# Altium schematic sheet Connector-Sheet.SchDoc
size 420 x 297 mm; SheetNumber: 10; SheetTotal: 11
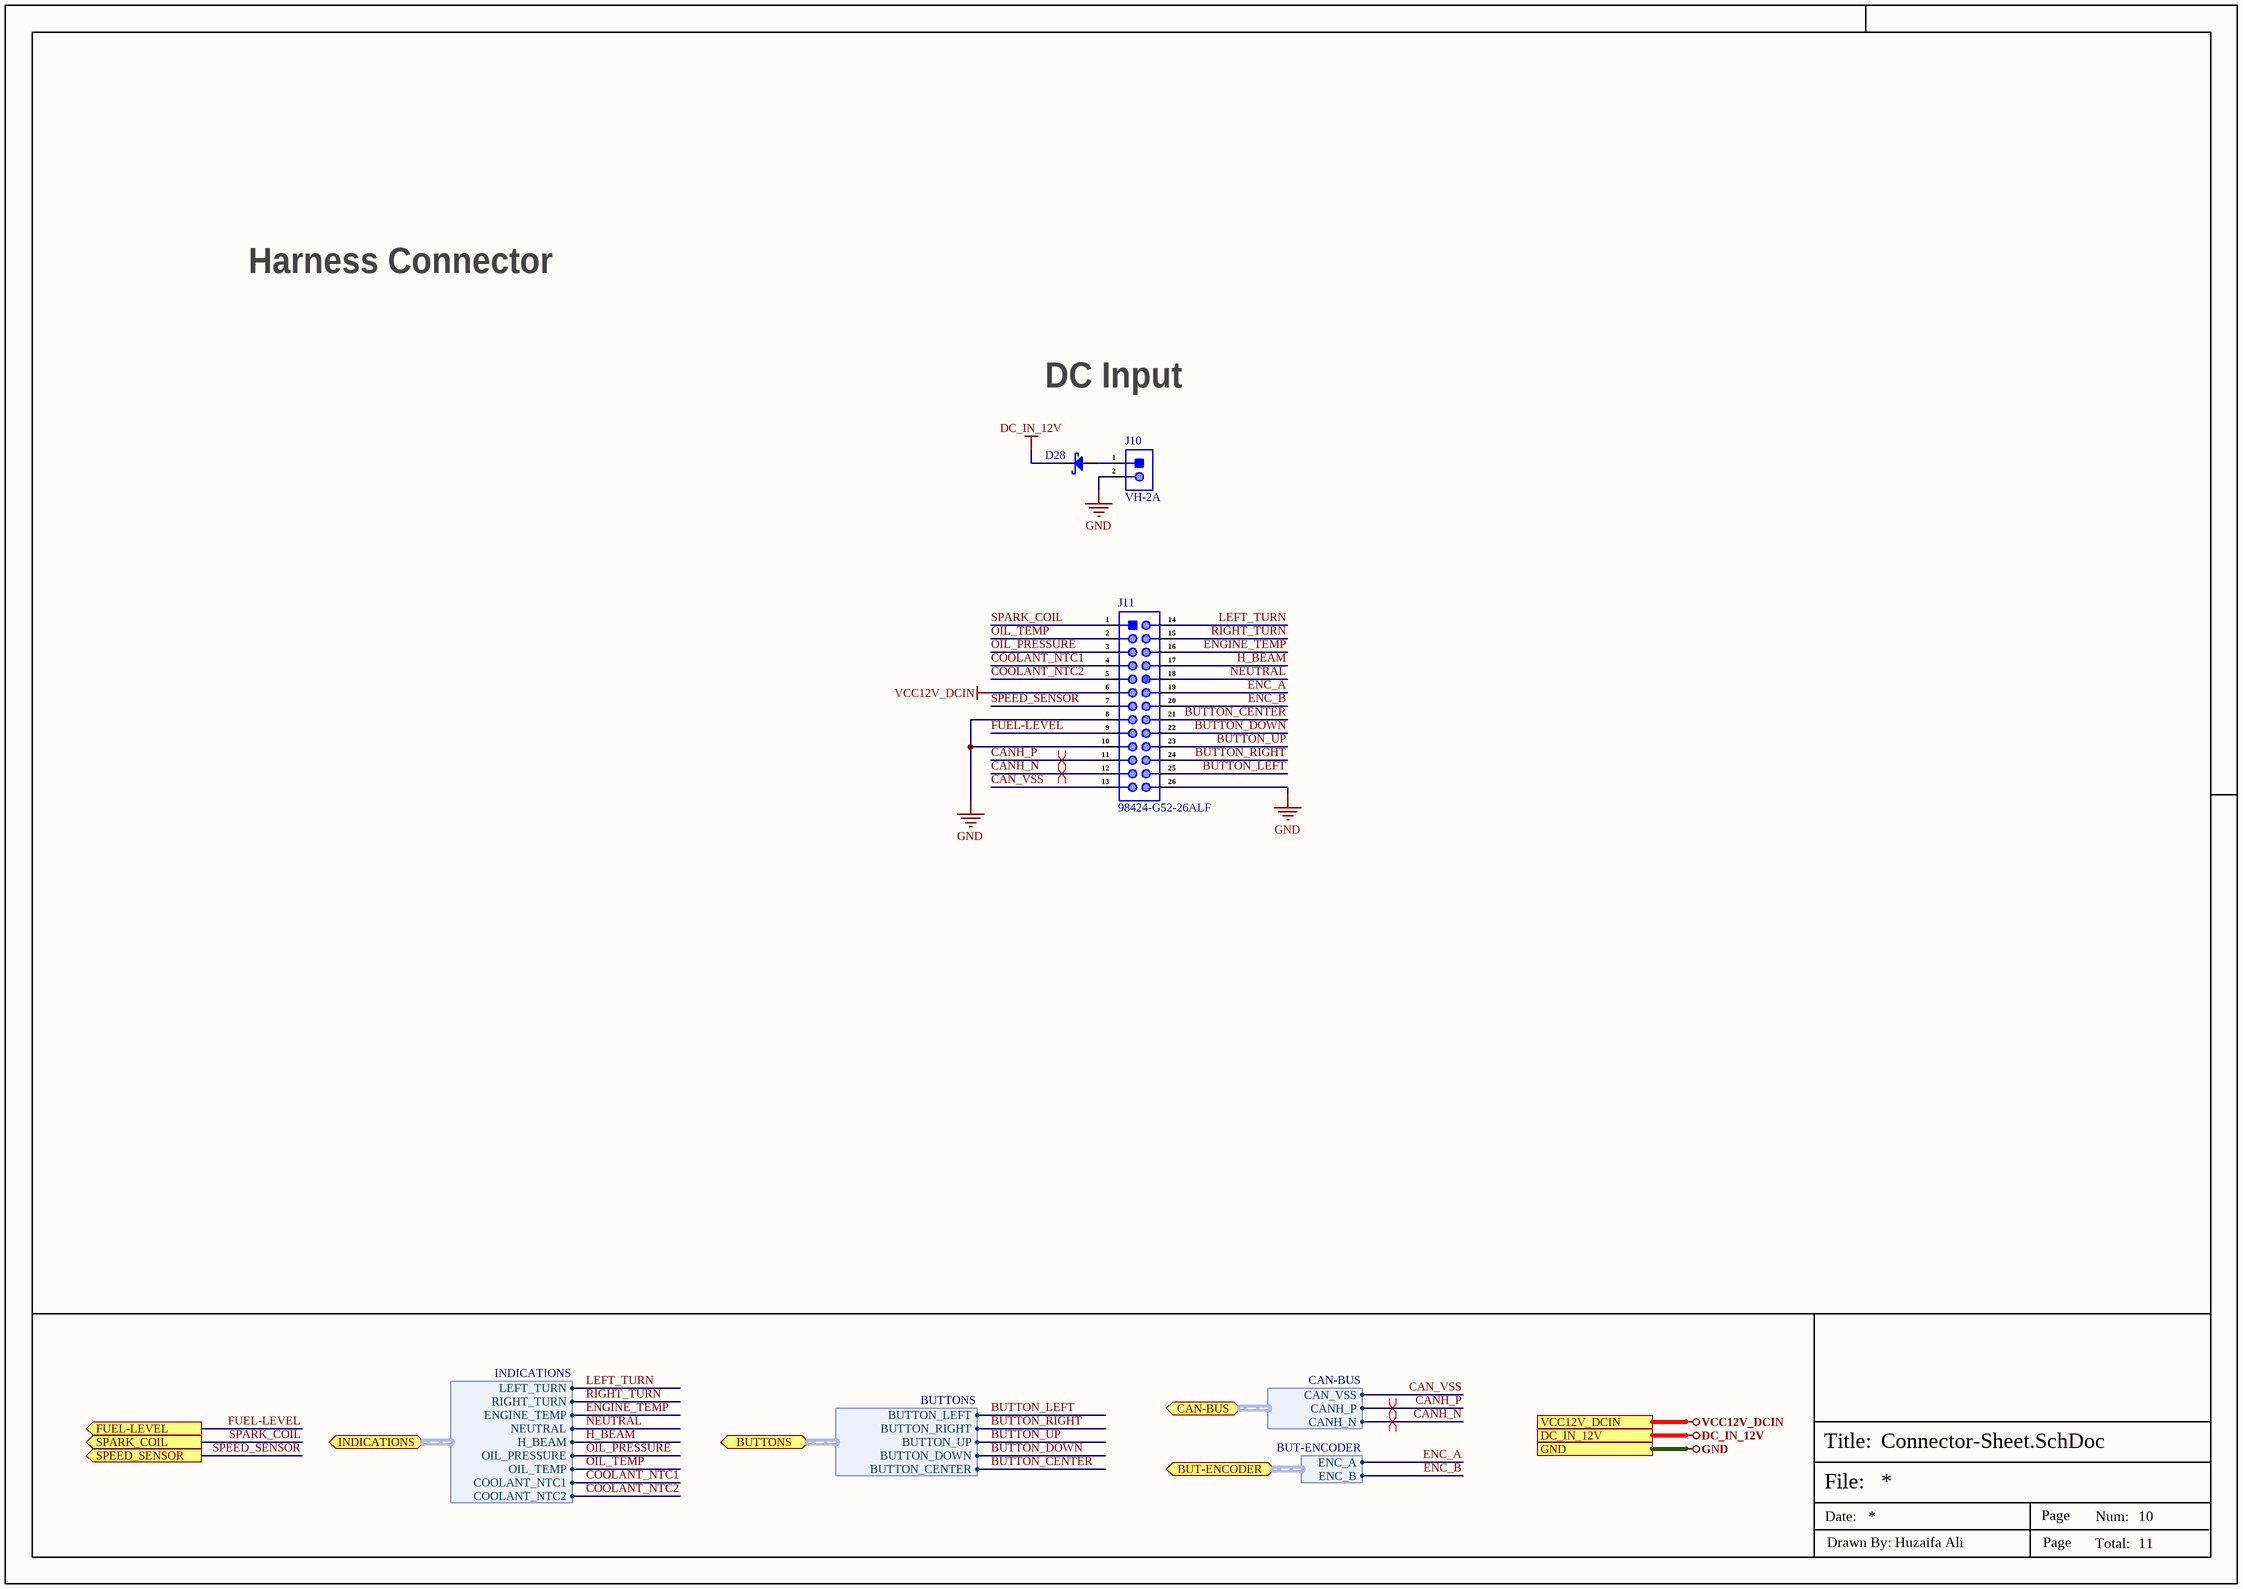
[diagram p0: Connector-Sheet.SchDoc]

## Parts
D28  SS34  [SMA]  (value not drawn)
J10  VH-2A  [VH-2A]
J11  98424-G52-26ALF  [98424-G52-26ALF]

## Ports
BUT-ENCODER (bidir, harness BUT-ENCODER, see Peripherals-Sheet-2[2D], TC-RK3568-Sheet[5C]), BUTTONS (bidir, harness BUTTONS, see Peripherals-Sheet-2[2D]), CAN-BUS (bidir, harness CAN-BUS, see CAN-Debug-Sheet[3D]), DC_IN_12V (see Power-Sheet[5D]), FUEL-LEVEL (out, see Peripherals-Sheet-1[6B]), GND (see CAN-Debug-Sheet[5D], HDMI-Sheet[5D], MIPI-Display-Sheet[5D], Peripherals-Sheet-1[5D], Peripherals-Sheet-2[5D], Power-Sheet[5D], TC-RK3568-Sheet[5D], TF-Card-Sheet[4D], USB-Sheet[5D], WiFi-Sheet[4D]), INDICATIONS (bidir, harness INDICATIONS, see Peripherals-Sheet-1[3D], Peripherals-Sheet-2[1D]), SPARK_COIL (out, see Peripherals-Sheet-1[1B]), SPEED_SENSOR (out, see Peripherals-Sheet-1[1D]), VCC12V_DCIN (see Peripherals-Sheet-1[5D], Power-Sheet[5D])

## Harnesses
BUTTONS: BUTTON_LEFT, BUTTON_RIGHT, BUTTON_UP, BUTTON_DOWN, BUTTON_CENTER
INDICATIONS: LEFT_TURN, RIGHT_TURN, ENGINE_TEMP, NEUTRAL, H_BEAM, OIL_PRESSURE, OIL_TEMP, COOLANT_NTC1, COOLANT_NTC2
CAN-BUS: CAN_VSS, CANH_P, CANH_N
BUT-ENCODER: ENC_A, ENC_B

## Nets
DC_IN_12V: D28.1(K) ; port DC_IN_12V
GND: J10.2 J11.8 J11.10 J11.26 ; port GND
VCC12V_DCIN: J11.6 ; port VCC12V_DCIN
BUTTON_CENTER: J11.21 ; port BUTTONS.BUTTON_CENTER
BUTTON_DOWN: J11.22 ; port BUTTONS.BUTTON_DOWN
BUTTON_LEFT: J11.25 ; port BUTTONS.BUTTON_LEFT
BUTTON_RIGHT: J11.24 ; port BUTTONS.BUTTON_RIGHT
BUTTON_UP: J11.23 ; port BUTTONS.BUTTON_UP
CAN_VSS: J11.13 ; port CAN-BUS.CAN_VSS
CANH_N: J11.12 ; port CAN-BUS.CANH_N
CANH_P: J11.11 ; port CAN-BUS.CANH_P
COOLANT_NTC1: J11.4 ; port INDICATIONS.COOLANT_NTC1
COOLANT_NTC2: J11.5 ; port INDICATIONS.COOLANT_NTC2
ENC_A: J11.19 ; port BUT-ENCODER.ENC_A
ENC_B: J11.20 ; port BUT-ENCODER.ENC_B
ENGINE_TEMP: J11.16 ; port INDICATIONS.ENGINE_TEMP
FUEL-LEVEL: J11.9 ; port FUEL-LEVEL
H_BEAM: J11.17 ; port INDICATIONS.H_BEAM
LEFT_TURN: J11.14 ; port INDICATIONS.LEFT_TURN
NEUTRAL: J11.18 ; port INDICATIONS.NEUTRAL
OIL_PRESSURE: J11.3 ; port INDICATIONS.OIL_PRESSURE
OIL_TEMP: J11.2 ; port INDICATIONS.OIL_TEMP
RIGHT_TURN: J11.15 ; port INDICATIONS.RIGHT_TURN
SPARK_COIL: J11.1 ; port SPARK_COIL
SPEED_SENSOR: J11.7 ; port SPEED_SENSOR
NetD28_2: D28.2(A) J10.1

## Layout directives
differential pair: CANH_N, CANH_P

## Notes on the sheet
- Harness Connector
- DC Input
- File:
- Title:
- Date:
- Page
- Num:
- Total:
- Drawn By: Huzaifa Ali

## Library data of the parts
D28 = SS34: 0.5mA@40V 40V Single 3A 0.55V@3A SMA(DO-214AC) Schottky Barrier Diodes (SBD) ROHS; Manufacturer: MDD; Item Type: Diode; Manufacturer Part Number: SS34; Package: SMA(DO-214AC); LCSC Part Number: C8678; ComponentLink1Description: LCSC; ComponentLink1URL: https://www.lcsc.com/product-detail/Schottky-Barrier-Diodes-SBD_MDD-Microdiode-Electronics-SS34_C8678.html
J10 = VH-2A: 2.00mm Pitch MicroClasp Wire-to-Board Header, Dual Row, Vertical, 24 Circuits, with PCB Locator; Manufacturer: BOOMELE; Item Type: Wire To Board Connector; Manufacturer Part Number: VH-2A; Package: Push-Pull,P=3.96mm; LCSC Part Number: C80347; ComponentLink1Description: LCSC; ComponentLink1URL: https://www.lcsc.com/product-detail/Wire-To-Board-span-style-background-color-ff0-Connector-span_BOOMELE-Boom-Precision-Elec-VH-2A_C80347.html; Supplier: Mouser; Supplier Part Number: 538-55917-2410; RoHS: Yes; Category: Headers and Wire Housings; Stock: 3772; Pricing: 1=1.36, 10=1.15, 50=1.15, 100=1.03, 1000=0.849, 10000=0.66 (USD); ComponentLink2URL: https://datasheet.ciiva.com/5156/0559172410-pcb-headers-171124-5156321.pdf?src-supplier=Mouser; ComponentLink2Description: https://datasheet.ciiva.com/5156/0559172410-pcb-headers-171124-5156321.pdf?src-supplier=Mouser
J11 = 98424-G52-26ALF: CONN HEADER SMD 26POS 2MM; Manufacturer: Amphenol ICC / FCI; Item Type: Headers and Wire Housings; Supplier: Avnet; Supplier Part Number: 65AC3204; Manufacturer Part Number: 98424-G52-26ALF; RoHS: Yes; Stock: 29; Pricing: 1=1.91 (USD); ComponentLink1URL: https://datasheet.ciiva.com/713/98424-713391.pdf?src-supplier=Digikey; ComponentLink1Description: https://datasheet.ciiva.com/713/98424-713391.pdf?src-supplier=Digikey; ComponentLink2URL: https://datasheet.ciiva.com/713/98424-713392.pdf?src-supplier=Digikey; ComponentLink2Description: https://datasheet.ciiva.com/713/98424-713392.pdf?src-supplier=Digikey; ComponentLink3URL: https://datasheet.ciiva.com/9473/98424-9473029.pdf?src-supplier=Avnet; ComponentLink3Description: https://datasheet.ciiva.com/9473/98424-9473029.pdf?src-supplier=Avnet; ComponentLink4URL: https://datasheet.ciiva.com/729/98424-729327.pdf?src-supplier=Digikey; ComponentLink4Description: https://datasheet.ciiva.com/729/98424-729327.pdf?src-supplier=Digikey; LCSC Part Number: C213188